# Altium schematic sheet Header_Sheet_3.SchDoc
size A; SheetNumber: 9; SheetTotal: 12
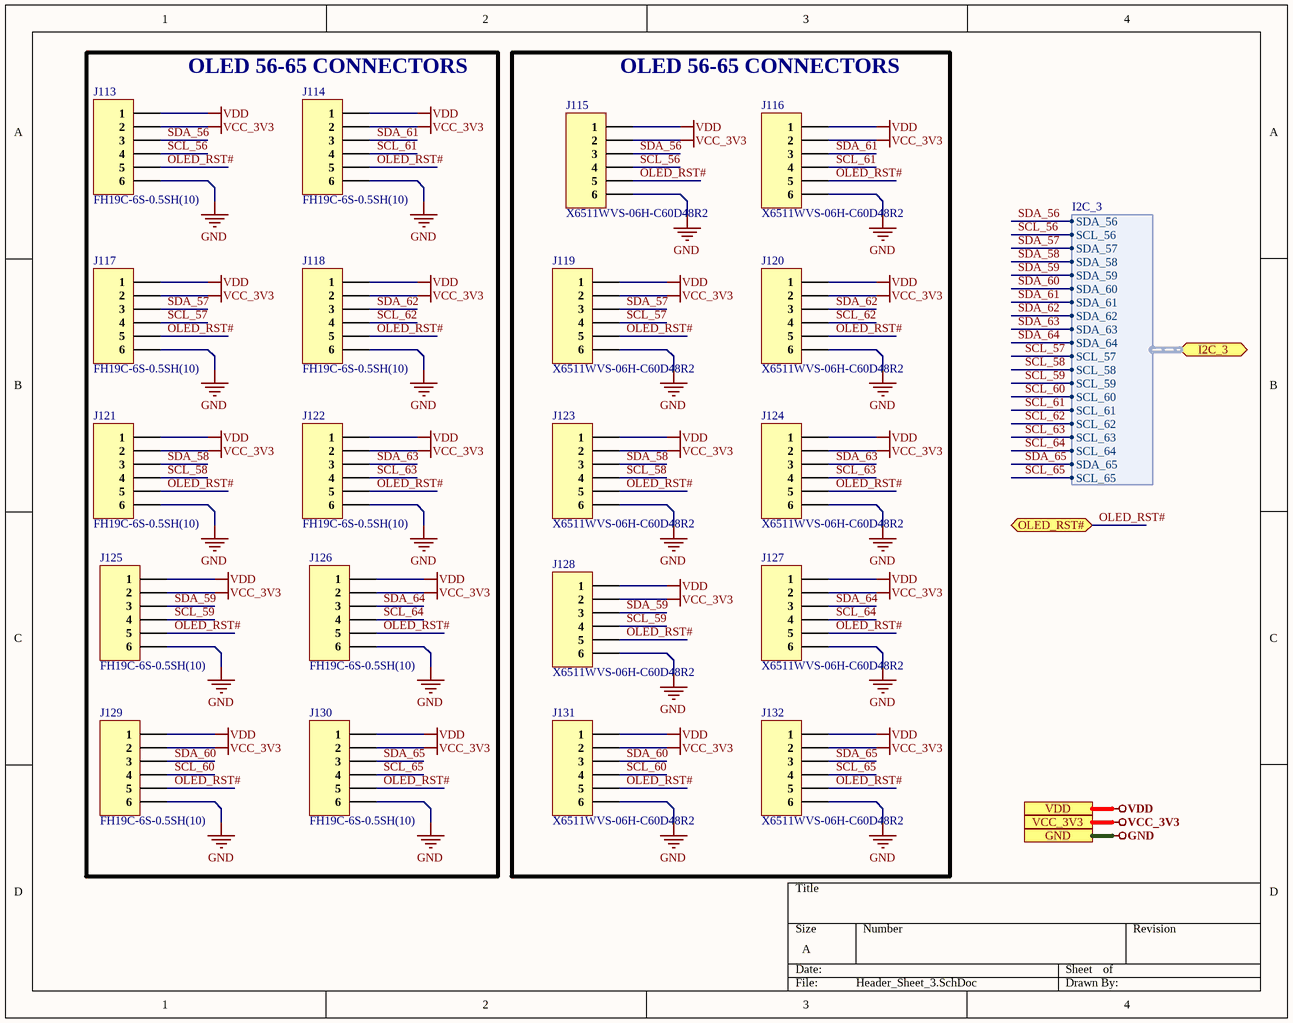
[diagram p0: Header_Sheet_3.SchDoc]

## Parts
J113  FH19C-6S-0.5SH(10)  [FH19C-6S-0.5SH(10)]
J114  FH19C-6S-0.5SH(10)  [FH19C-6S-0.5SH(10)]
J115  X6511WVS-06H-C60D48R2  [X6511WVS-06H-C60D48R2]
J116  X6511WVS-06H-C60D48R2  [X6511WVS-06H-C60D48R2]
J117  FH19C-6S-0.5SH(10)  [FH19C-6S-0.5SH(10)]
J118  FH19C-6S-0.5SH(10)  [FH19C-6S-0.5SH(10)]
J119  X6511WVS-06H-C60D48R2  [X6511WVS-06H-C60D48R2]
J120  X6511WVS-06H-C60D48R2  [X6511WVS-06H-C60D48R2]
J121  FH19C-6S-0.5SH(10)  [FH19C-6S-0.5SH(10)]
J122  FH19C-6S-0.5SH(10)  [FH19C-6S-0.5SH(10)]
J123  X6511WVS-06H-C60D48R2  [X6511WVS-06H-C60D48R2]
J124  X6511WVS-06H-C60D48R2  [X6511WVS-06H-C60D48R2]
J125  FH19C-6S-0.5SH(10)  [FH19C-6S-0.5SH(10)]
J126  FH19C-6S-0.5SH(10)  [FH19C-6S-0.5SH(10)]
J127  X6511WVS-06H-C60D48R2  [X6511WVS-06H-C60D48R2]
J128  X6511WVS-06H-C60D48R2  [X6511WVS-06H-C60D48R2]
J129  FH19C-6S-0.5SH(10)  [FH19C-6S-0.5SH(10)]
J130  FH19C-6S-0.5SH(10)  [FH19C-6S-0.5SH(10)]
J131  X6511WVS-06H-C60D48R2  [X6511WVS-06H-C60D48R2]
J132  X6511WVS-06H-C60D48R2  [X6511WVS-06H-C60D48R2]

## Blocks framed on the sheet
OLED 56-65 CONNECTORS: J113 J114 J117 J118 J121 J122 J125 J126 J129 J130
OLED 56-65 CONNECTORS: J115 J116 J119 J120 J123 J124 J127 J128 J131 J132

## Ports
GND, I2C_3 (bidir, harness I2C_3), OLED_RST# (bidir), VCC_3V3, VDD

## Harnesses
I2C_3: SDA_56, SCL_56, SDA_57, SDA_58, SDA_59, SDA_60, SDA_61, SDA_62, SDA_63, SDA_64, SCL_57, SCL_58, SCL_59, SCL_60, SCL_61, SCL_62, SCL_63, SCL_64, SDA_65, SCL_65

## Nets
GND: J113.6 J114.6 J115.6 J116.6 J117.6 J118.6 J119.6 J120.6 J121.6 J122.6 J123.6 J124.6 J125.6 J126.6 J127.6 J128.6 J129.6 J130.6 J131.6 J132.6 ; port GND
VCC_3V3: J113.2 J114.2 J115.2 J116.2 J117.2 J118.2 J119.2 J120.2 J121.2 J122.2 J123.2 J124.2 J125.2 J126.2 J127.2 J128.2 J129.2 J130.2 J131.2 J132.2 ; port VCC_3V3
VDD: J113.1 J114.1 J115.1 J116.1 J117.1 J118.1 J119.1 J120.1 J121.1 J122.1 J123.1 J124.1 J125.1 J126.1 J127.1 J128.1 J129.1 J130.1 J131.1 J132.1 ; port VDD
OLED_RST#: J113.5 J114.5 J115.5 J116.5 J117.5 J118.5 J119.5 J120.5 J121.5 J122.5 J123.5 J124.5 J125.5 J126.5 J127.5 J128.5 J129.5 J130.5 J131.5 J132.5 ; port OLED_RST#
SCL_56: J113.4 J115.4 ; port I2C_3.SCL_56
SCL_57: J117.4 J119.4 ; port I2C_3.SCL_57
SCL_58: J121.4 J123.4 ; port I2C_3.SCL_58
SCL_59: J125.4 J128.4 ; port I2C_3.SCL_59
SCL_60: J129.4 J131.4 ; port I2C_3.SCL_60
SCL_61: J114.4 J116.4 ; port I2C_3.SCL_61
SCL_62: J118.4 J120.4 ; port I2C_3.SCL_62
SCL_63: J122.4 J124.4 ; port I2C_3.SCL_63
SCL_64: J126.4 J127.4 ; port I2C_3.SCL_64
SCL_65: J130.4 J132.4 ; port I2C_3.SCL_65
SDA_56: J113.3 J115.3 ; port I2C_3.SDA_56
SDA_57: J117.3 J119.3 ; port I2C_3.SDA_57
SDA_58: J121.3 J123.3 ; port I2C_3.SDA_58
SDA_59: J125.3 J128.3 ; port I2C_3.SDA_59
SDA_60: J129.3 J131.3 ; port I2C_3.SDA_60
SDA_61: J114.3 J116.3 ; port I2C_3.SDA_61
SDA_62: J118.3 J120.3 ; port I2C_3.SDA_62
SDA_63: J122.3 J124.3 ; port I2C_3.SDA_63
SDA_64: J126.3 J127.3 ; port I2C_3.SDA_64
SDA_65: J130.3 J132.3 ; port I2C_3.SDA_65

## Library data of the parts
J113 J114 J117 J118 J121 J122 J125 J126 J129 J130 = FH19C-6S-0.5SH(10): 0.5mm Pitch, 0.9mm Height, No of Contact 4-50, FPC/FFC Connector, 0.5 A, -55 to 85 ℃, RoHS; Manufacturer: Hirose; Supplier 1: Digi-Key; Manufacturer Part Number: FH19C-6S-0.5SH(10); RoHS: Yes; Category: FFC / FPC; Stock 1: 1159; Pricing 1: 1=1.10000, 10=0.96900, 25=0.91200, 50=0.87400, 100=0.83600, 250=0.76000, 500=0.68400, 1000=0.60800, 2500=0.55100 (USD); ComponentLink1URL: https://datasheet.ciiva.com/18563/ed-fh19cfh19sc-20140305-18563530.pdf?src-supplier=Digi-Key; ComponentLink1Description: https://datasheet.ciiva.com/18563/ed-fh19cfh19sc-20140305-18563530.pdf?src-supplier=Digi-Key; Supplier Part Number 1: H125824CT-ND
J115 J116 J119 J120 J123 J124 J127 J128 J131 J132 = X6511WVS-06H-C60D48R2: 6 POS 2.54mm SMD Header; Manufacturer: XKB Connectivity; Voltage Rating (Max): 250V; Current Rating (Max): 3A; Circluar Pins/Square Pins: Square Pins; ComponentLink1Description: LCSC; ComponentLink1URL: https://lcsc.com/product-detail/span-style-background-color-ff0-Pin-span-Headers_XKB-Connectivity-X6511WVS-06H-C60D48R2_C2883763.html; Insulation Height: 2.5mm; Length of Mating Pin: 6mm